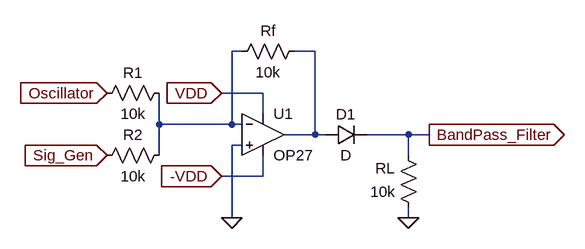
[diagram p0: schematic Switching_Modulator.asc]
Switching_Modulator.asc, the LTspice schematic file:
Version 4.1
SHEET 1 880 680
WIRE -80 -352 -96 -352
WIRE 32 -352 0 -352
WIRE -48 -288 -112 -288
WIRE -48 -256 -48 -288
WIRE -208 -240 -208 -288
WIRE -96 -240 -96 -352
WIRE -96 -240 -208 -240
WIRE -80 -240 -96 -240
WIRE 32 -224 32 -352
WIRE 32 -224 -16 -224
WIRE 48 -224 32 -224
WIRE 176 -224 112 -224
WIRE 208 -224 176 -224
WIRE -80 -208 -96 -208
WIRE -208 -192 -208 -240
WIRE 176 -192 176 -224
WIRE -48 -160 -48 -192
WIRE -48 -160 -112 -160
WIRE -96 -96 -96 -208
WIRE 176 -96 176 -112
FLAG -96 -96 0
FLAG 176 -96 0
FLAG -112 -288 VDD
IOPIN -112 -288 In
FLAG -112 -160 -VDD
IOPIN -112 -160 In
FLAG 208 -224 BandPass_Filter
IOPIN 208 -224 Out
FLAG -288 -288 Oscillator
IOPIN -288 -288 In
FLAG -288 -192 Sig_Gen
IOPIN -288 -192 In
SYMBOL OpAmps\\OP27 -48 -288 R0
SYMATTR InstName U1
SYMBOL res 16 -368 R90
WINDOW 0 0 56 VBottom 2
WINDOW 3 32 56 VTop 2
SYMATTR InstName Rf
SYMATTR Value 10k
SYMBOL res 192 -96 R180
WINDOW 0 36 76 Left 2
WINDOW 3 36 40 Left 2
SYMATTR InstName RL
SYMATTR Value 10k
SYMBOL res -304 -176 R270
WINDOW 0 32 56 VTop 2
WINDOW 3 0 56 VBottom 2
SYMATTR InstName R2
SYMATTR Value 10k
SYMBOL res -304 -272 R270
WINDOW 0 32 56 VTop 2
WINDOW 3 0 56 VBottom 2
SYMATTR InstName R1
SYMATTR Value 10k
SYMBOL diode 48 -208 R270
WINDOW 0 32 32 VTop 2
WINDOW 3 0 32 VBottom 2
SYMATTR InstName D1

The netlist it stands for:
* Switching_Modulator.asc
X§U1 0 N001 VDD -VDD N002 OP27  ; pins In+ In- V+ V- OUT
Rf N002 N001 10k
RL 0 BandPass_Filter 10k
R2 Sig_Gen N001 10k
R1 Oscillator N001 10k
D1 N002 BandPass_Filter D
.model D D
.lib standard.dio
.lib ADI.lib
.backanno
.end